# Altium schematic sheet A1_next.SchDoc
size 840 x 594 mm; DocumentNumber: Введите номер платы + Э3; SheetNumber: номер страницы; Format: A1
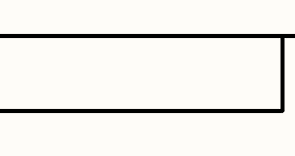
[diagram p0: A1_next.SchDoc, top left]
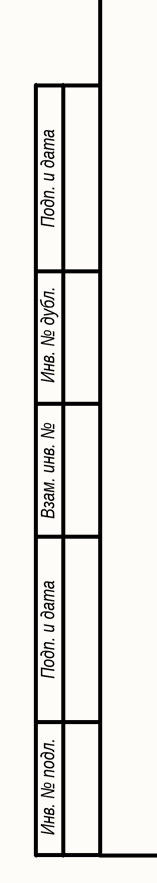
[diagram p1: A1_next.SchDoc, bottom left]
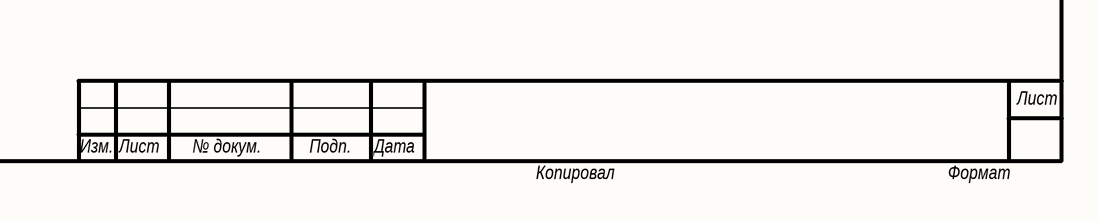
[diagram p2: A1_next.SchDoc, bottom right]

## Notes on the sheet
- Подп. и дата
- Инв. № дубл.
- Взам. инв. №
- Инв. № подл.
- Лист
- Изм.
- № докум.
- Подп.
- Дата
- Копировал
- Формат